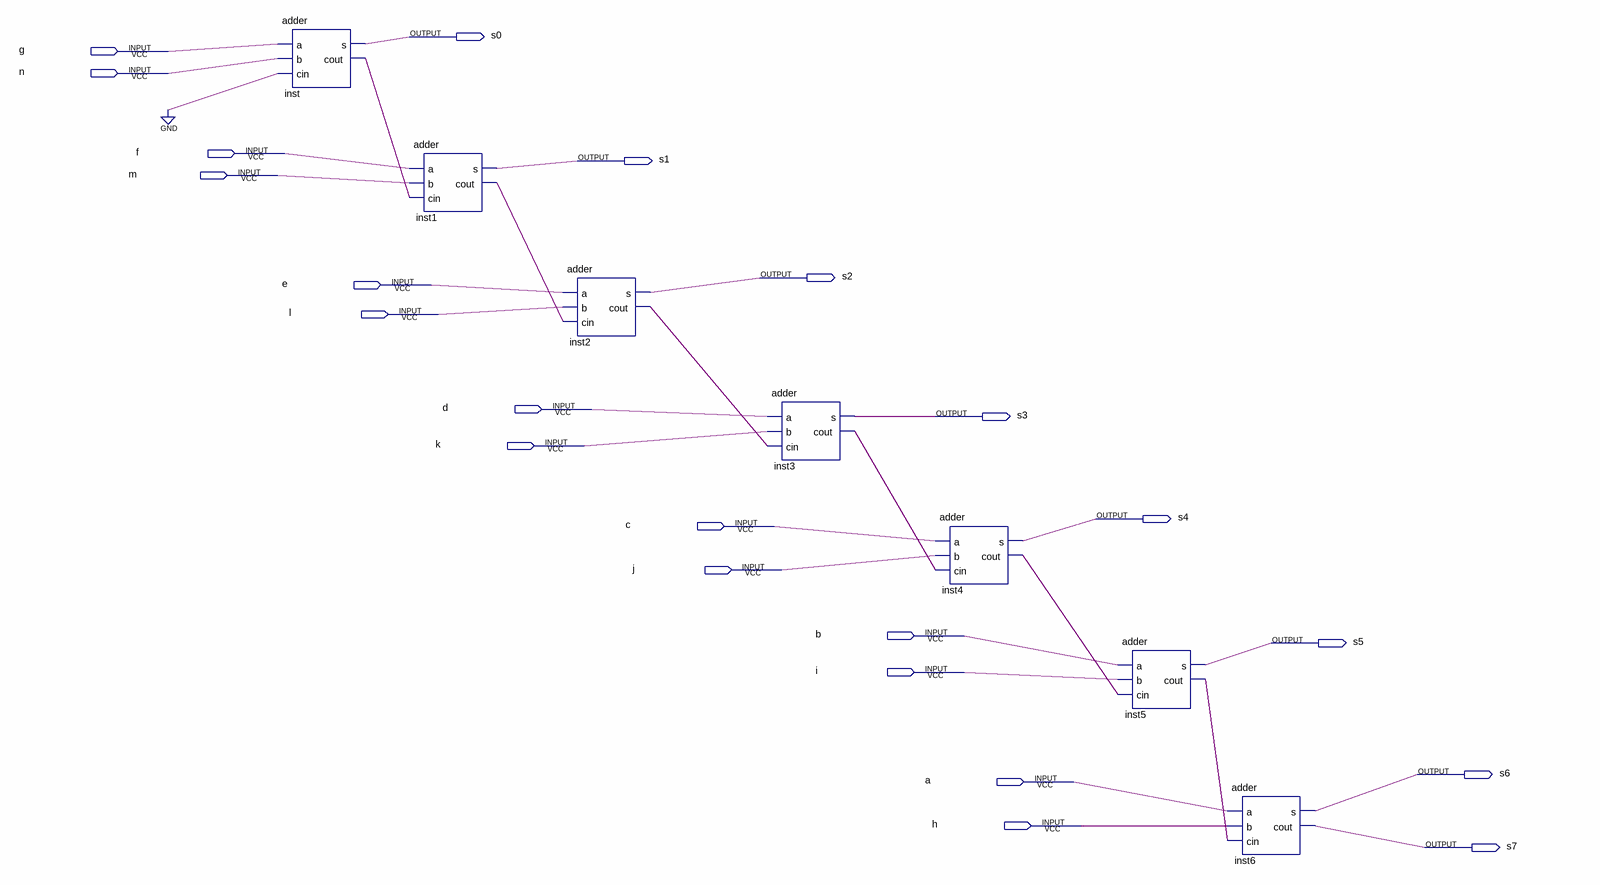
[diagram p0: schematic sheet]
// Quartus schematic adder7bits.bdf as structural Verilog: 7 symbols, 22 pins
module adder7bits (
  input  g,
  input  n,
  input  f,
  input  m,
  input  e,
  input  l,
  input  d,
  input  k,
  input  c,
  input  j,
  input  b,
  input  i,
  input  a,
  input  h,
  output s0,
  output s1,
  output s2,
  output s3,
  output s4,
  output s5,
  output s6,
  output s7
);

  wire inst1_cout, inst2_cout, inst3_cout, inst4_cout, inst5_cout, inst_cout;

  adder inst (.a(g), .b(n), .cin(1'b0), .s(s0), .cout(inst_cout));
  adder inst1 (.a(f), .b(m), .cin(inst_cout), .s(s1), .cout(inst1_cout));
  adder inst2 (.a(e), .b(l), .cin(inst1_cout), .s(s2), .cout(inst2_cout));
  adder inst3 (.a(d), .b(k), .cin(inst2_cout), .s(s3), .cout(inst3_cout));
  adder inst4 (.a(c), .b(j), .cin(inst3_cout), .s(s4), .cout(inst4_cout));
  adder inst5 (.a(b), .b(i), .cin(inst4_cout), .s(s5), .cout(inst5_cout));
  adder inst6 (.a(a), .b(h), .cin(inst5_cout), .s(s6), .cout(s7));
endmodule
